# Altium project NMP_TempMonitoring.PrjPcb
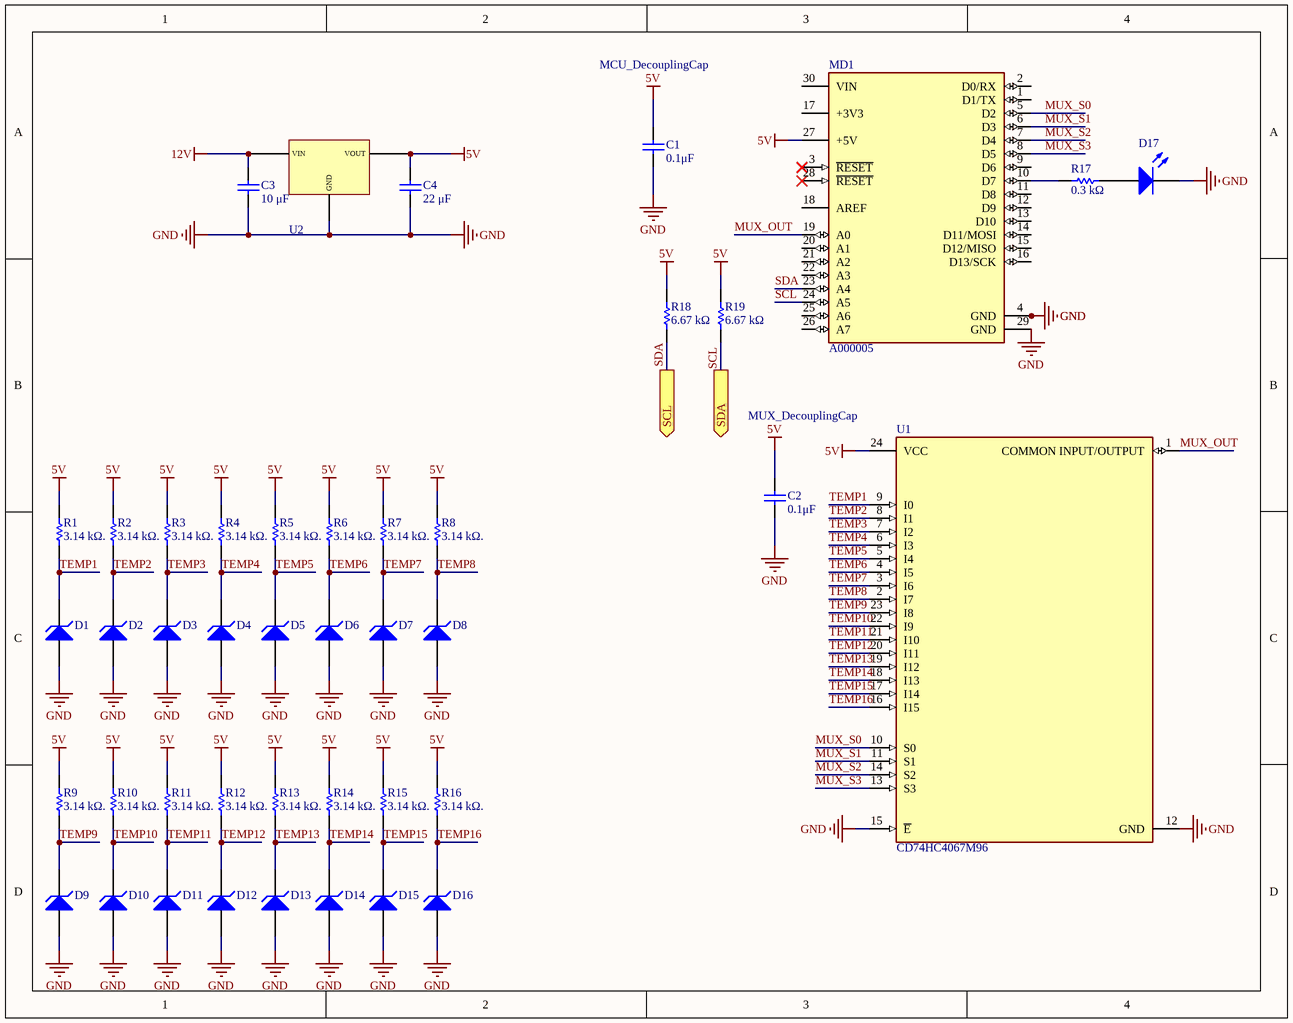
[diagram p0: TempMonitor.SchDoc]
1 sheet, 43 parts. Net scope: flat (ports and power ports of the same name join across sheets).

## Sheet TempMonitor.SchDoc: NMP Temperature Monitoring Board
size A; Date: 10/21/2026; Author: Neev Chilkuri; DrawnBy: Neev Chilkuri; SheetNumber: 1; SheetTotal: 1

### Parts
C1  value 0.1μF  (hidden comment: Capacitor)
C2  value 0.1μF  (hidden comment: Capacitor)
C3  value 10 μF  (hidden comment: Capacitor)
C4  value 22 μF  (hidden comment: Capacitor)
D1  Zener Diode  (value not drawn)
D2  Zener Diode  (value not drawn)
D3  Zener Diode  (value not drawn)
D4  Zener Diode  (value not drawn)
D5  Zener Diode  (value not drawn)
D6  Zener Diode  (value not drawn)
D7  Zener Diode  (value not drawn)
D8  Zener Diode  (value not drawn)
D9  Zener Diode  (value not drawn)
D10  Zener Diode  (value not drawn)
D11  Zener Diode  (value not drawn)
D12  Zener Diode  (value not drawn)
D13  Zener Diode  (value not drawn)
D14  Zener Diode  (value not drawn)
D15  Zener Diode  (value not drawn)
D16  Zener Diode  (value not drawn)
D17  Light-Emitting Diode  (value not drawn)
MD1  A000005  [FP-A000005-MFG]
R1  value 3.14 kΩ.  (hidden comment: Resistor)
R2  value 3.14 kΩ.  (hidden comment: Resistor)
R3  value 3.14 kΩ.  (hidden comment: Resistor)
R4  value 3.14 kΩ.  (hidden comment: Resistor)
R5  value 3.14 kΩ.  (hidden comment: Resistor)
R6  value 3.14 kΩ.  (hidden comment: Resistor)
R7  value 3.14 kΩ.  (hidden comment: Resistor)
R8  value 3.14 kΩ.  (hidden comment: Resistor)
R9  value 3.14 kΩ.  (hidden comment: Resistor)
R10  value 3.14 kΩ.  (hidden comment: Resistor)
R11  value 3.14 kΩ.  (hidden comment: Resistor)
R12  value 3.14 kΩ.  (hidden comment: Resistor)
R13  value 3.14 kΩ.  (hidden comment: Resistor)
R14  value 3.14 kΩ.  (hidden comment: Resistor)
R15  value 3.14 kΩ.  (hidden comment: Resistor)
R16  value 3.14 kΩ.  (hidden comment: Resistor)
R17  value 0.3 kΩ  (hidden comment: Resistor)
R18  value 6.67 kΩ  (hidden comment: Resistor)
R19  value 6.67 kΩ  (hidden comment: Resistor)
U1  CD74HC4067M96  [FP-DW0024A-MFG]
U2  LME78_05-1.0  (value not drawn)

### Ports
SCL (out), SDA (out)

### Nets
5V: C1.2 C2.2 C4.2 MD1.27(+5V) R1.1 R2.1 R3.1 R4.1 R5.1 R6.1 R7.1 R8.1 R9.1 R10.1 R11.1 R12.1 R13.1 R14.1 R15.1 R16.1 R18.2 R19.2 U1.24(VCC) U2.4(VOUT)
12V: C3.2 U2.3(VIN)
GND: C1.1 C2.1 C3.1 C4.1 D1.1(A) D2.1(A) D3.1(A) D4.1(A) D5.1(A) D6.1(A) D7.1(A) D8.1(A) D9.1(A) D10.1(A) D11.1(A) D12.1(A) D13.1(A) D14.1(A) D15.1(A) D16.1(A) D17.2(K) MD1.4(GND) MD1.29(GND) U1.12(GND) U1.15(~{E}) U2.5(GND)
MUX_OUT: MD1.19(A0) U1.1(COMMON_INPUT/OUTPUT)
MUX_S0: MD1.5(D2) U1.10(S0)
MUX_S1: MD1.6(D3) U1.11(S1)
MUX_S2: MD1.7(D4) U1.14(S2)
MUX_S3: MD1.8(D5) U1.13(S3)
SCL: MD1.24(A5) R19.1 ; port SDA
SDA: MD1.23(A4) R18.1 ; port SCL
TEMP1: D1.2(K) R1.2 U1.9(I0)
TEMP2: D2.2(K) R2.2 U1.8(I1)
TEMP3: D3.2(K) R3.2 U1.7(I2)
TEMP4: D4.2(K) R4.2 U1.6(I3)
TEMP5: D5.2(K) R5.2 U1.5(I4)
TEMP6: D6.2(K) R6.2 U1.4(I5)
TEMP7: D7.2(K) R7.2 U1.3(I6)
TEMP8: D8.2(K) R8.2 U1.2(I7)
TEMP9: D9.2(K) R9.2 U1.23(I8)
TEMP10: D10.2(K) R10.2 U1.22(I9)
TEMP11: D11.2(K) R11.2 U1.21(I10)
TEMP12: D12.2(K) R12.2 U1.20(I11)
TEMP13: D13.2(K) R13.2 U1.19(I12)
TEMP14: D14.2(K) R14.2 U1.18(I13)
TEMP15: D15.2(K) R15.2 U1.17(I14)
TEMP16: D16.2(K) R16.2 U1.16(I15)
NetD17_1: D17.1(A) R17.2
NetMD1_10: MD1.10(D7) R17.1

Not connected (* = marked no-connect by the designer): MD1 1(D1/TX) 2(D0/RX) 3(~{RESET})* 9(D6) 11(D8) 12(D9) 13(D10) 14(D11/MOSI) 15(D12/MISO) 16(D13/SCK) 17(+3V3) 18(AREF) 20(A1) 21(A2) 22(A3) 25(A6) 26(A7) 28(~{RESET})* 30(VIN)

### Notes on the sheet
- MCU_DecouplingCap
- MUX_DecouplingCap

### Library data of the parts
C1-C4 = Capacitor: SimulationGenericComponent: True
D1-D16 = Zener Diode: AF: 1; BV_MAX: 1e99; CJO: 0; EG: 1.11; FC: 0.5; IBV: 0.001; IS: 1e-14; MJSW: 0.33; NTUN: 30; TNOM: 27; XTI: 3; SimulationGenericComponent: True; BV: 100; CJP: 0; CTA: 0; CTP: 0; FCS: 0.5; FV_MAX: 1e99; IKF: 0; IKR: 0; ISR: 1e-14; JSW: 0; JTUN: 0; JTUNSW: 0; KEG: 1; KF: 0; LEVEL: 1; N: 1; NBV: 1; NR: 1; NS: 1; PHP: 1; RS: 0; TCV: 0; TLEV: 0; TLEVC: 0; TM1: 0; TM2: 0; TPB: 0; TPHP: 0; TRS: 0; TRS2: 0; TT: 0; TTT1: 0; TTT2: 0; VJ: 1; XTITUN: 3
D17 = LED: AF: 1; BV: 0; BV_MAX: 1e99; EG: 1.11; FC: 0.5; IBV: 0.001; IS: 1e-14; MJSW: 0.33; NTUN: 30; TNOM: 27; XTI: 3; SimulationGenericComponent: True; CJO: 0; CJP: 0; CTA: 0; CTP: 0; FCS: 0.5; FV_MAX: 1e99; IKF: 0; IKR: 0; ISR: 1e-14; JSW: 0; JTUN: 0; JTUNSW: 0; KEG: 1; KF: 0; LEVEL: 1; N: 1; NBV: 1; NR: 1; NS: 1; PHP: 1; RS: 0; TCV: 0; TLEV: 0; TLEVC: 0; TM1: 0; TM2: 0; TPB: 0; TPHP: 0; TRS: 0; TRS2: 0; TT: 0; TTT1: 0; TTT2: 0; VJ: 1; XTITUN: 3
MD1 = CMP-189986-000002-1: ARDUINO NANO ATMEGA328 EVAL BRD; Number of Bits: 8; Evaluation Kit: Yes; Operating Supply Voltage: 12V; Interface: I2C; Data Bus Width: 8b; Core Architecture: AVR; Packaging: Bulk; Length: 7inch; Package Quantity: 50; Width: 5inch; REACH SVHC: No SVHC; Weight: 0.358383oz; Series: AVR® ATmega; Height: 0.25inch
R1-R19 = Resistor: TC1: 0; SimulationGenericComponent: True; TC2: 0
U1 = CMP-04901-000007-1: IC MUX/DEMUX 1X16 24SOIC; Manufacturer: Texas Instruments; Standoff Height: 0.1mm; Logic Function Desc: Non-Inverting; Max Supply Voltage: 6V; Number Of Inputs: 16; Quiescent Current: 8uA; Number Of Circuits: 1; Propagation Delay: 6ns; Max Junction Temp: +150°C; Min Supply Voltage: 2V; ComponentLink2Description: Datasheet; Octopart: https://octopart.com/cd74hc4067m96-texas+instruments-722802; Ambient Temperature Range High: +125°C; Ipc Land Pattern Name: SOIC127P1030X265-24; Height: 2.65mm; Mouser Description: Multiplexer Switch ICs Hi-Spd CMOS 16Ch Anl Mltplxr/Demltplxr; Temperature Range Low: -55°C; Package: DW0024A; Temperature Range High: +125°C; Lead Free: Yes; ComponentLink2URL: http://www.ti.com/lit/ds/symlink/cd74hc4067.pdf; Manufacturer Part Number: CD74HC4067M96; RoHS: TRUE; Automotive: No; Device Class L1: Integrated Circuits (ICs); Digikey Description: IC MUX/DEMUX 1X16 24SOIC; Device Class L2: Logic ICs; Temperature: -55°C to +125°C; Device Class L3: Multiplexers; Category: IC; Ambient Temperature Range Low: -55°C; Number Of Outputs: 1
U2 = LME78_05-1.0: NON-ISOLATED POL MODULE DC DC CO